# EAGLE schematic untitled (EAGLE 9.6.2)
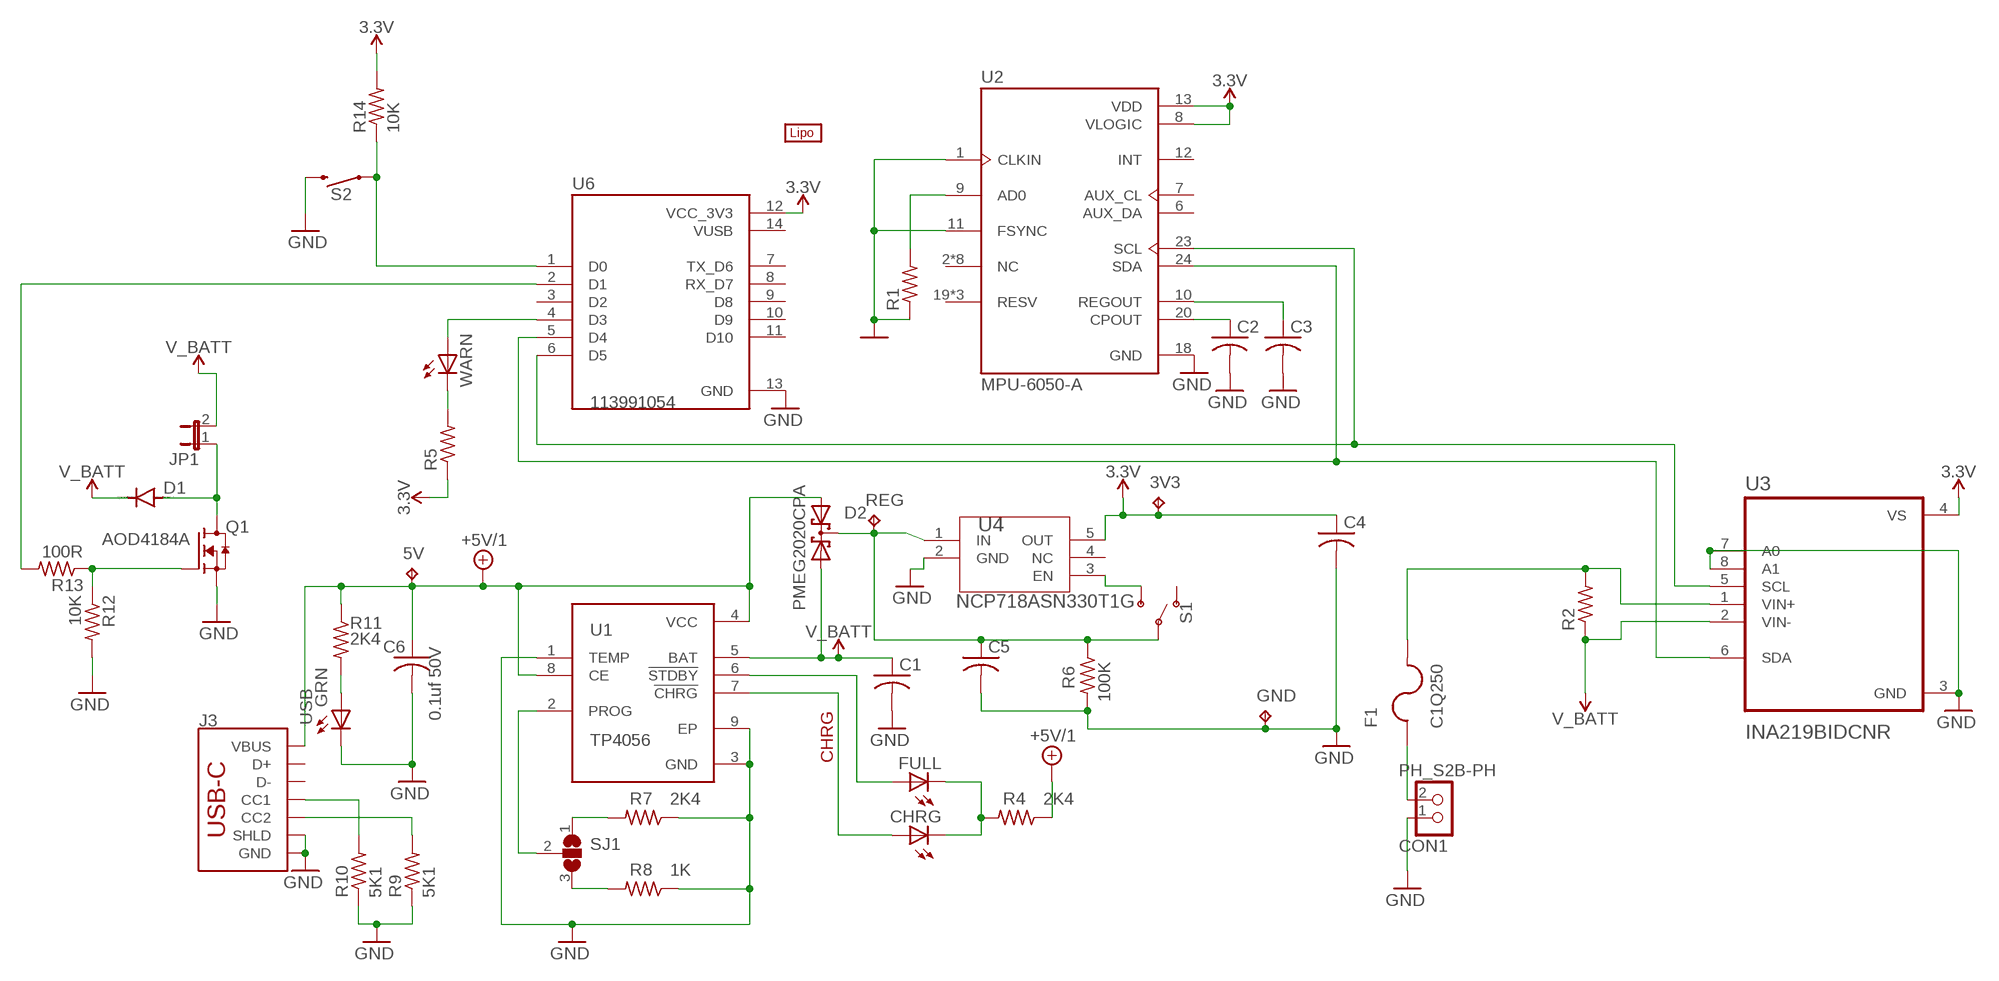
[diagram p0: schematic, sheet 1]

## Parts
3V3  TPB1,27  [B1,27]
5V  TPB1,27  [B1,27]
BT1  LIPO-OUTLINE1000  [LIPO-1000]
C1  C-USC0603  [C0603]
C2  C-USC0603  [C0603]
C3  C-USC0603  [C0603]
C4  C-USC0603  [C0603]
C5  C-USC0603  [C0603]
C6  0.1uf 50V  C-USC0805  [C0805]
CHRG  LEDCHIPLED_0603  [CHIPLED_0603]
CON1  PH_S2B-PH  [S2B-PH]
D1  DIODE-DO-214AC  [DO-214AC]
D2  PMEG2020CPA  [SOT1061]
F1  C1Q250  [C1Q250]
FULL  LEDCHIPLED_0603  [CHIPLED_0603]
GND  TPB1,27  [B1,27]
J3  USB Female Type C Connector  USB_C_4-LAYER-ISOLATED  [USB-C-16P-4LAYER-ISOLATED]
JP1  JP1E  [JP1]
Q1  AOD4184A  [DPAK228P994X240-4N]
R1  R-US_R0603  [R0603]
R2  R-US_M1206  [M1206]
R4  2K4  R-US_R0603  [R0603]
R5  R-US_R0603  [R0603]
R6  100K  R-US_R0603  [R0603]
R7  2K4  R-US_R0603  [R0603]
R8  1K  R-US_R0603  [R0603]
R9  5K1  R-US_R0603  [R0603]
R10  5K1  R-US_R0603  [R0603]
R11  2K4  R-US_R0603  [R0603]
R12  10K  R-US_R0603  [R0603]
R13  100R  R-US_R0603  [R0603]
R14  10K  R-US_R0603  [R0603]
REG  TPB1,27  [B1,27]
S1  SWITCH-SPDT-SMD-RIGHT-ANGLE  [SWITCH_SPST_SMD_A]
S2  MOMENTARY-SWITCH-SPST-PTH-12MM  [TACTILE_SWITCH_PTH_12MM]
SJ1  SJ2W  [SJ_2]
U1  TP4056  [SOP127P600X175-9N]
U2  MPU-6050-A  [QFN50P400X400X95-24N]
U3  INA219BIDCNR  [SOT65P280X145-8N]
U4  NCP718ASN330T1G  [TSOT23-5_ONS]
U6  113991054  [MODULE_113991054]
USB  GRN  LEDCHIPLED_0805  [CHIPLED_0805]
WARN  LEDCHIPLED_0603  [CHIPLED_0603]

## Nets
3.3V: 3V3.TP C4.1 R5.1 R14.2 U2.8(VLOGIC) U2.13(VDD) U3.4(VS) U4.5(OUT) U6.12(VCC_3V3)
+5V/1: 5V.TP C6.1 D2.1(A1) J3.VBUS1(VBUS) J3.VBUS2(VBUS) R4.1 R11.1 U1.4(VCC) U1.8(CE)
CHRG: CHRG.A U1.7(!CHRG)
FULL: FULL.A U1.6(!STDBY)
GND: C1.2 C2.2 C3.2 C4.2 C5.2 C6.2 CON1.1 GND.TP J3.GND J3.GND2(GND) J3.SHLD1(SHLD) J3.SHLD2(SHLD) J3.SHLD3(SHLD) J3.SHLD4(SHLD) J3.SHLD5(SHLD) J3.SHLD6(SHLD) J3.SHLD7(SHLD) J3.SHLD8(SHLD) Q1.3(S) R1.1 R6.2 R7.1 R8.1 R9.1 R10.1 R12.2 S2.3 U1.1(TEMP) U1.3(GND) U1.9(EP) U2.1(CLKIN) U2.11(FSYNC) U2.18(GND) U3.3(GND) U3.7(A0) U3.8(A1) U4.2(GND) U6.13(GND) USB.C
N$1: C5.1 D2.3(K1K2) R6.1 REG.TP S1.2(P) U4.1(IN)
N$2: CHRG.C FULL.C R4.2
N$3: U2.23(SCL) U3.5(SCL) U6.6(D5)
N$4: R13.2 U6.2(D1)
N$6: R14.1 S2.1 U6.1(D0)
N$7: F1.2 R2.2 U3.1(VIN+)
N$8: C3.1 U2.10(REGOUT)
N$9: C2.1 U2.20(CPOUT)
N$10: D1.A JP1.1 Q1.4(D)
N$11: CON1.2 F1.1
N$12: R1.2 U2.9(AD0)
N$13: R5.2 WARN.C
N$14: U6.4(D3) WARN.A
N$15: S1.3(S) U4.3(EN)
N$16: J3.A5(CC1) R10.2
N$18: R7.2 SJ1.1
N$19: J3.B5(CC2) R9.2
N$21: R8.2 SJ1.3
N$22: SJ1.2 U1.2(PROG)
N$24: U2.24(SDA) U3.6(SDA) U6.5(D4)
N$26: R11.2 USB.A
N$41: Q1.1(G) R12.1 R13.1
V_BATT: C1.1 D1.C D2.2(A2) JP1.2 R2.1 U1.5(BAT) U3.2(VIN-)
Unconnected: J3.A6(D+) J3.A7(D-) J3.B6(D+) J3.B7(D-) S1.1(O) U2.2(NC) U2.3(NC) U2.4(NC) U2.5(NC) U2.6(AUX_DA) U2.7(AUX_CL) U2.12(INT) U2.14(NC) U2.15(NC) U2.16(NC) U2.17(NC) U2.19(RESV) U2.21(RESV) U2.22(RESV) U4.4(NC) U6.3(D2) U6.7(TX_D6) U6.8(RX_D7) U6.9(D8) U6.10(D9) U6.11(D10)

## Power pins joined to a net without a drawn wire
VUSB: U6.14(VUSB)

## Library data of the parts
3V3 5V GND REG = testpad:TP: Test pad
BT1 = SparkFun-Batteries:LIPO-OUTLINE: LiPo Battery Outlines Outlines for common LiPo batteries sold by SparkFun. (Note: no terminals or connection points, just the dimensions.) SparkFun Products Polymer Lithium Ion Battery - 110mAh <https://www.sparkfun.com/products/13853> (PRT-13853) Polymer Lithium Ion Battery - 1000mAh <https://www.sparkfun.com/products/13813> (PRT-13813) Polymer Lithium Ion Battery - 2000mAh <https://www.sparkfun.com/products/8483> (PRT-08483); PROD_ID: BATT-13243; SF_SKU: PRT-13813
C1-C5 = adafruit:C-US: CAPACITOR, American symbol
C6 = rcl:C-US: CAPACITOR, American symbol; SPICEPREFIX: C
CHRG FULL USB WARN = adafruit:LED: LED OSRAM: - CHIPLED LG R971, LG N971, LY N971, LG Q971, LY Q971, LO R971, LY R971 LH N974, LH R974 LS Q976, LO Q976, LY Q976 LO Q996 - Hyper CHIPLED LW Q18S LB Q993, LB Q99A, LB R99A - SideLED LS A670, LO A670, LY A670, LG A670, LP A670 LB A673, LV A673, LT A673, LW A673 LH A674 LY A675 LS A676, LA A676, LO A676, LY A676, LW A676 LS A679, LY A679, LG A679 - Hyper Micro SIDELED® LS Y876, LA Y876, LO Y876, LY Y876 LT Y87S - SmartLED LW L88C, LW L88S LB L89C, LB L89S, LG L890 LS L89K, LO L89K, LY L89K LS L896, LA L896, LO L896, LY L896 - TOPLED LS T670, LO T670, LY T670, LG T670, LP T670 LSG T670, LSP T670, LSY T670, LOP T670, LYG T670 LG T671, LOG T671, LSG T671 LB T673, LV T673, LT T673, LW T673 LH T674 LS T676, LA T676, LO T676, LY T676, LB T676, LH T676, LSB T676, LW T676 LB T67C, LV T67C, LT T67C, LS T67K, LO T67K, LY T67K, LW E67C LS E67B, LA E67B, LO E67B, LY E67B, LB E67C, LV E67C, LT E67C LW T67C LS T679, LY T679, LG T679 LS T770, LO T770, LY T770, LG T770, LP T770 LB T773, LV T773, LT T773, LW T773 LH T774 LS E675, LA E675, LY E675, LS T675 LS T776, LA T776, LO T776, LY T776, LB T776 LHGB T686 LT T68C, LB T68C - Hyper Mini TOPLED® LB M676 - Mini TOPLED Santana® LG M470 LS M47K, LO M47K, LY M47K Source: http://www.osram.convergy.de/
CON1 = CASE-JST:PH_S2B-PH: JST PH Connector, through hole, 2 pin, side entry Description: JST PH connector with 2.0 mm pitch, through hole version, 2 pin, side entry. Links: Datasheet <http://www.jst-mfg.com/product/pdf/eng/ePH.pdf>
D1 = diode:DIODE-: DIODE
D2 = PMEG2020CPA:PMEG2020CPA: Check availability <https://pricing.snapeda.com/parts/PMEG2020CPA/Nexperia/view-part?ref=eda>; AVAILABILITY: In Stock; CHECK_PRICES: https://www.snapeda.com/parts/PMEG2020CPA/Nexperia/view-part/?ref=eda; DESCRIPTION: Diode Array 1 Pair Common Cathode Schottky 20V 2A Surface Mount 3-PowerUDFN; MF: Nexperia; MP: PMEG2020CPA; PACKAGE: PowerUDFN-3 NXP Semiconductors; PRICE: None; SNAPEDA_LINK: https://www.snapeda.com/parts/PMEG2020CPA/Nexperia/view-part/?ref=snap
F1 = Fuse:C1Q250: FUSE BRD MNT 250MA 125VAC 63VDC Manufacturer's datasheet <https://belfuse.com/resources/datasheets/circuitprotection/ds-cp-c1q-series.pdf>; CREATED_BY: PCBLayout.com; DIGIKEY_PARTNO: 507-1073-1-ND; MANUFACTURER: Bel Fuse Inc.; MPN: C1Q 250
J3 = SparkFun-Connectors:USB_C: USB Type C 16Pin Connector Super Speed pins not available on the 16-pin purely SMD connector so this part is best for USB 2.0 implementations. D1 and D2 are tied together enabling D+/- no matter which way the cable is plugged into the connector. The two channel configuration pins (CC1/2) are exposed. These are normally connected to ground via 5.1k resistors but can be reconfigured for high current/high power applications. **4-LAYER BOARD WARNING!!** If designing 4-layer board, make sure to select the variant _4-LAYER-ISOLATED. The linked footprint (USB-C-16-4LAYER-ISOLATED) includes some very necessary cutout polygons in the inner layers (2 and 15). This prevents the PTH mounting shield legs on the USB connector from electrically connecting any other polygons on the inner layers (usually VCC and GND).; PROD_ID: CONN-14122
JP1 = jumper:JP1E: JUMPER
Q1 = AOD4184A:AOD4184A: Trans MOSFET N-CH 40V 50A 3-Pin(2+Tab) DPAK Check availability <https://pricing.snapeda.com/parts/AOD4184A/Alpha%20%26%20Omega%20Semiconductor%20Inc./view-part?ref=eda>; AVAILABILITY: In Stock; CHECK_PRICES: https://www.snapeda.com/parts/AOD4184A/Alpha+%2526+Omega+Semiconductor+Inc./view-part/?ref=eda; DESCRIPTION: N-Channel 40 V 13A (Ta), 50A (Tc) 2.3W (Ta), 50W (Tc) Surface Mount TO-252 (DPAK); MF: Alpha & Omega Semiconductor Inc.; MP: AOD4184A; PACKAGE: None; PRICE: None; SNAPEDA_LINK: https://www.snapeda.com/parts/AOD4184A/Alpha+%2526+Omega+Semiconductor+Inc./view-part/?ref=snap
R1 R2 R4-R14 = adafruit:R-US_: RESISTOR, American symbol
S1 = SparkFun-Switches:SWITCH-SPDT: Single Pole, Double Throw (SPDT) Switch Single-pole, double-throw (SPDT) switch. Variant Overview SMD-AYZ0202 Surface Mount DPDT Switch <https://www.sparkfun.com/products/597> (COM-00597) Used on e.g. LilyPad Arduino USB - ATmega32U4 Board <https://www.sparkfun.com/products/12049> PTH-11.6X4.0MM SPDT Mini Power Switch <https://www.sparkfun.com/products/102> (COM-00102) Used on e.g. SparkFun Simon Says - Through-Hole Soldering Kit <https://www.sparkfun.com/products/10547> (KIT-10547) PTH-11.6X4.0MM-KIT KIT version of SPDT Mini Power Switch - Simplifies soldering by removing tStop of switch pins - only one side can be soldered. PTH-11.6X4.0MM-LOCK LOCK version of SPDT Mini Power Switch - Offset pins hold switch in place for easier soldering. SMD-RIGHT-ANGLE Surface Mount Right Angle Switch <https://www.sparkfun.com/products/10860> (COM-10860) Used on e.g. SparkFun ESP8266 Thing <https://www.sparkfun.com/products/13231>; PROD_ID: SWCH-10651; SF_SKU: COM-10860
S2 = SparkFun-Switches:MOMENTARY-SWITCH-SPST: Momentary Switch (Pushbutton) - SPST Normally-open (NO) SPST momentary switches (buttons, pushbuttons). Variants PTH-12MM - 12mm square, through-hole Momentary Pushbutton Switch - 12mm Square <https://www.sparkfun.com/products/9190> (COM-09190) PTH-6.0MM, PTH-6.0MM-KIT - 6.0mm square, through-hole Mini Pushbutton Switch <https://www.sparkfun.com/products/97> (COM-00097) KIT package intended for soldering kit's - only one side of pads' copper is exposed. PTH-RIGHT-ANGLE-KIT - Right-angle, through-hole Right Angle Tactile Button <https://www.sparkfun.com/products/10791> - Used on SparkFun BigTime Watch Kit <https://www.sparkfun.com/products/11734> SMD-12MM - 12mm square, surface-mount Tactile Button - SMD (12mm) <https://www.sparkfun.com/products/12993> (COM-12993) Used on SparkFun PicoBoard <https://www.sparkfun.com/products/11888> SMD-4.5MM - 4.5mm Square Trackball Switch Used on SparkFun Blackberry Trackballer Breakout <https://www.sparkfun.com/products/13169> SMD-4.6MMX2.8MM - 4.60mm x 2.80mm, surface mount Used on SparkFun Pro Micro - RP2040 <https://www.sparkfun.com/products/17717> SMD-5.2MM, SMD-5.2-REDUNDANT - 5.2mm square, surface-mount Mini Pushbutton Switch - SMD <https://www.sparkfun.com/products/8720> (COM-08720) Used on Arduino Pro Mini <https://www.sparkfun.com/products/11114> REDUNDANT package connects both switch circuits together SMD-6.0X3.5MM - 6.0 x 3.5mm, surface mount Momentary Reset Switch SMD <https://www.sparkfun.com/products/8229> (COM-08229) SMD-6.2MM-TALL - 6.2mm square, surface mount Tactile Button - SMD (6mm) <https://www.sparkfun.com/products/12992> Used on SparkFun Digital Sandbox <https://www.sparkfun.com/products/12651> SMD-RIGHT-ANGLE - Right-angle, surface mount Used on SparkFun Block for Intel® Edison - Arduino <https://www.sparkfun.com/products/13036>; PROD_ID: SWCH-09185; SF_SKU: COM-09190
SJ1 = jumper:SJ2W: SMD solder JUMPER
U1 = TP4056 (1):TP4056: Complete single cell Li-Ion battery with a constant current / constant voltage linear charger Check availability <https://pricing.snapeda.com/parts/TP4056/NanJing%20Top%20Power%20ASIC%20Corp./view-part?ref=eda>; AVAILABILITY: Not in stock; CHECK_PRICES: https://www.snapeda.com/parts/TP4056/NanJing+Top+Power+ASIC+Corp./view-part/?ref=eda; DESCRIPTION: Complete single cell Li-Ion battery with a constant current / constant voltage linear charger; MF: NanJing Top Power ASIC Corp.; MP: TP4056; PACKAGE: Package; PRICE: None; SNAPEDA_LINK: https://www.snapeda.com/parts/TP4056/NanJing+Top+Power+ASIC+Corp./view-part/?ref=snap
U2 = MPU-6050-A:MPU-6050-A: Check availability <https://pricing.snapeda.com/parts/MPU-6050-A/TDK%20InvenSense/view-part?ref=eda>; AVAILABILITY: In Stock; CHECK_PRICES: https://www.snapeda.com/parts/MPU-6050-A/TDK/view-part/?ref=eda; DESCRIPTION: MOTION TRACKING DEVICE; MF: TDK InvenSense; MP: MPU-6050-A; PACKAGE: QFN-24 InvenSense; PRICE: None; SNAPEDA_LINK: https://www.snapeda.com/parts/MPU-6050-A/TDK/view-part/?ref=snap
U3 = INA219BIDCNR:INA219BIDCNR: Check availability <https://pricing.snapeda.com/parts/INA219BIDCNR/Texas%20Instruments/view-part?ref=eda>; AVAILABILITY: In Stock; CHECK_PRICES: https://www.snapeda.com/parts/INA219BIDCNR/Texas+Instruments/view-part/?ref=eda; DESCRIPTION: 26-V 12-bit I2C output digital power monitor; MF: Texas Instruments; MP: INA219BIDCNR; PACKAGE: SOT-23-8 Texas Instruments; PRICE: None; PURCHASE-URL: https://www.snapeda.com/api/url_track_click_mouser/?unipart_id=870494&manufacturer=Texas Instruments&part_name=INA219BIDCNR&search_term=ina219; SNAPEDA_LINK: https://www.snapeda.com/parts/INA219BIDCNR/Texas+Instruments/view-part/?ref=snap
U4 = NCP718ASN330T1G:NCP718ASN330T1G: Check availability <https://pricing.snapeda.com/parts/NCP718ASN330T1G/onsemi/view-part?ref=eda>; AVAILABILITY: In Stock; CHECK_PRICES: https://www.snapeda.com/parts/NCP718ASN330T1G/Onsemi/view-part/?ref=eda; DESCRIPTION: Linear Voltage Regulator IC Positive Fixed 1 Output 300mA TSOT-23-5; MF: onsemi; MP: NCP718ASN330T1G; PACKAGE: TSOT-23-5 ON Semiconductor; PRICE: None; SNAPEDA_LINK: https://www.snapeda.com/parts/NCP718ASN330T1G/Onsemi/view-part/?ref=snap
U6 = 113991054:113991054: Check availability <https://pricing.snapeda.com/parts/113991054/Seeed%20Technology%20Co.%2C%20Ltd/view-part?ref=eda>; AVAILABILITY: In Stock; CHECK_PRICES: https://www.snapeda.com/parts/113991054/Seeed+Studio/view-part/?ref=eda; DESCRIPTION: - ESP32-C3 Transceiver; 802.11 a/b/g/n (Wi-Fi, WiFi, WLAN), Bluetooth® Smart 4.x Low Energy (BLE) 2.4GHz Evaluation Board; MF: Seeed Technology Co., Ltd; MP: 113991054; PACKAGE: None; PRICE: None; SNAPEDA_LINK: https://www.snapeda.com/parts/113991054/Seeed+Studio/view-part/?ref=snap